# EAGLE schematic schematic (EAGLE 9.7.0)
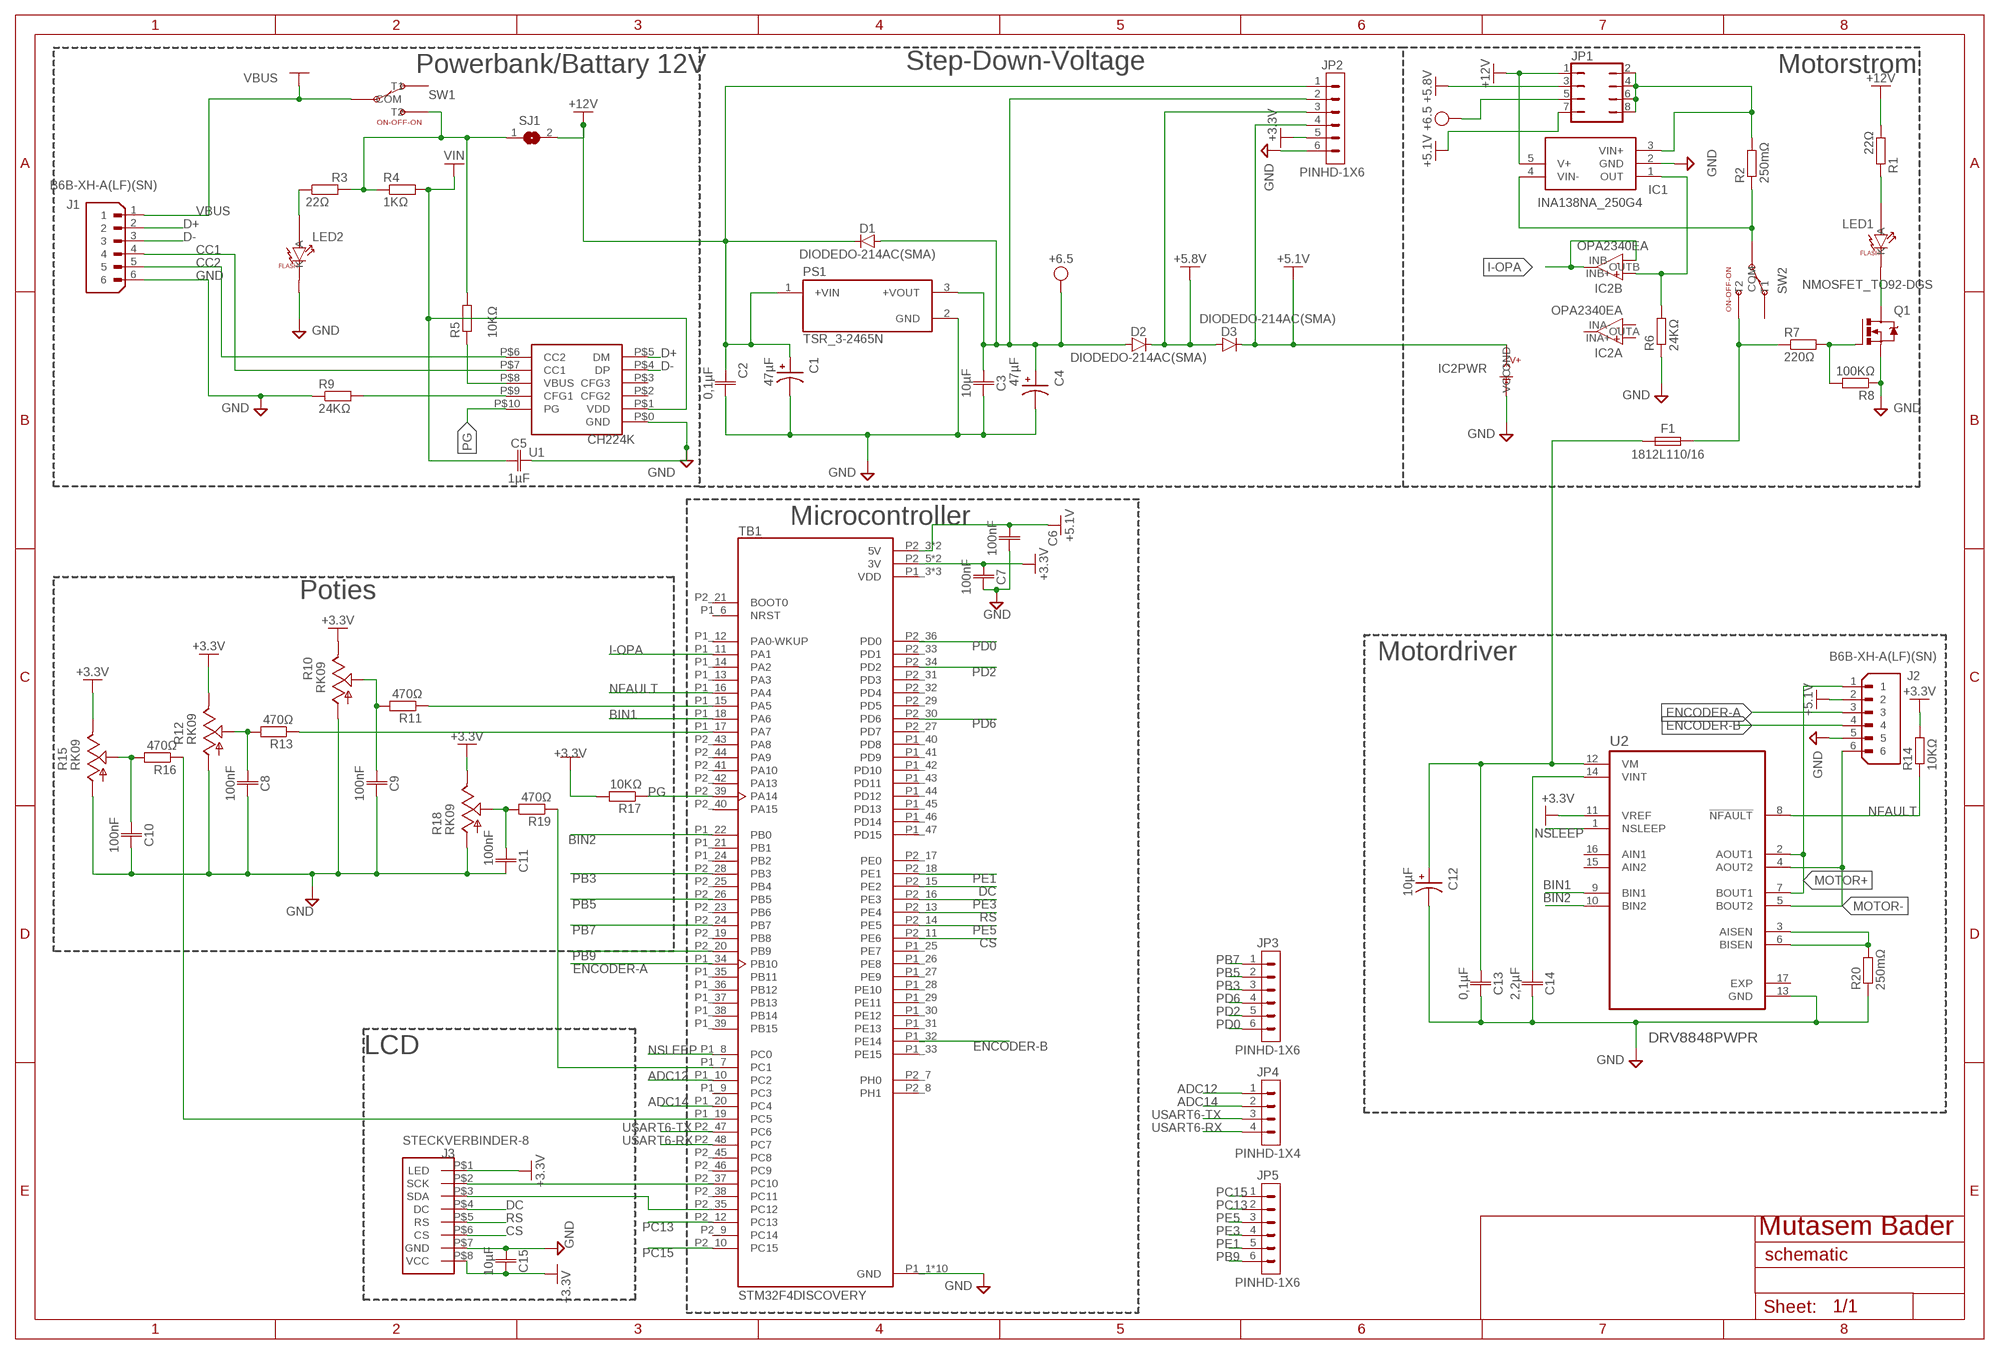
[diagram p0: schematic, sheet 1]

## Parts
C1  47µF  EEUEB1H470SH  [CAPPRD250W50D630H1120]
C2  0,1µF  C_CHIP-1206(3216-METRIC)  [CAPC3216X135]
C3  10µF  C_CHIP-1206(3216-METRIC)  [CAPC3216X135]
C4  47µF  EEUEB1H470SH  [CAPPRD250W50D630H1120]
C5  1µF  C_CHIP-1206(3216-METRIC)  [CAPC3216X135]
C6  100nF  C_CHIP-1206(3216-METRIC)  [CAPC3216X135]
C7  100nF  C_CHIP-1206(3216-METRIC)  [CAPC3216X135]
C8  100nF  C_CHIP-1206(3216-METRIC)  [CAPC3216X135]
C9  100nF  C_CHIP-1206(3216-METRIC)  [CAPC3216X135]
C10  100nF  C_CHIP-1206(3216-METRIC)  [CAPC3216X135]
C11  100nF  C_CHIP-1206(3216-METRIC)  [CAPC3216X135]
C12  10µF  EEUEB1H100S  [CAPPRD200W50D500H1100]
C13  0,1µF  C_CHIP-1206(3216-METRIC)  [CAPC3216X135]
C14  2,2µF  C_CHIP-1206(3216-METRIC)  [CAPC3216X135]
C15  10µF  C_CHIP-1206(3216-METRIC)  [CAPC3216X135]
D1  DIODEDO-214AC(SMA)  [DIOM5226X290N]
D2  DIODEDO-214AC(SMA)  [DIOM5226X290N]
D3  DIODEDO-214AC(SMA)  [DIOM5226X290N]
F1  1812L110/16  [FUSC4532X125]
IC1  INA138NA_250G4  [SOT95P280X145-5N]
IC2  OPA2340EA  [VSSOP-8-DGK]
J1  B6B-XH-A(LF)(SN)  [JST_B6B-XH-A(LF)(SN)]
J2  B6B-XH-A(LF)(SN)  [JST_B6B-XH-A(LF)(SN)]
J3  STECKVERBINDER-8  [STECKEVERINDER-8]
JP1  JP4Q  [JP4Q]
JP2  PINHD-1X6  [1X06]
JP3  PINHD-1X6  [1X06]
JP4  PINHD-1X4  [1X04]
JP5  PINHD-1X6  [1X06]
LED1  19060001-PANEL  [CML-19060001-PANEL-M8]
LED2  19060001-PANEL  [CML-19060001-PANEL-M8]
PS1  TSR_3-2465N  [CONV_TSR_3-2465N]
Q1  NMOSFET_TO92-DGS  [TO92]
R1  22Ω  R_CHIP-1206(3216-METRIC)  [RESC3216X70]
R2  250mΩ  R_CHIP-1206(3216-METRIC)  [RESC3216X70]
R3  22Ω  R_CHIP-1206(3216-METRIC)  [RESC3216X70]
R4  1KΩ  R_CHIP-1206(3216-METRIC)  [RESC3216X70]
R5  10KΩ  R_CHIP-1206(3216-METRIC)  [RESC3216X70]
R6  24KΩ  R_CHIP-1206(3216-METRIC)  [RESC3216X70]
R7  220Ω  R_CHIP-1206(3216-METRIC)  [RESC3216X70]
R8  100KΩ  R_CHIP-1206(3216-METRIC)  [RESC3216X70]
R9  24KΩ  R_CHIP-1206(3216-METRIC)  [RESC3216X70]
R10  RK09  [RK09]
R11  470Ω  R_CHIP-1206(3216-METRIC)  [RESC3216X70]
R12  RK09  [RK09]
R13  470Ω  R_CHIP-1206(3216-METRIC)  [RESC3216X70]
R14  10KΩ  R_CHIP-1206(3216-METRIC)  [RESC3216X70]
R15  RK09  [RK09]
R16  470Ω  R_CHIP-1206(3216-METRIC)  [RESC3216X70]
R17  10KΩ  R_CHIP-1206(3216-METRIC)  [RESC3216X70]
R18  RK09  RK09K1130A6S  [RK09K1130A6S]
R19  470Ω  R_CHIP-1206(3216-METRIC)  [RESC3216X70]
R20  250mΩ  R_CHIP-1206(3216-METRIC)  [RESC3216X70]
SJ1  SJ  [SJ]
SW1  10022-PANEL  [GOOBAY-10022-PANEL]
SW2  10022-PANEL  [GOOBAY-10022-PANEL]
TB1  STM32F4DISCOVERY  [MODULE_STM32F4DISCOVERY]
U1  CH224K  [CH224K]
U2  DRV8848PWPR  [IC_DRV8848PWPR]

## Nets
+3.3V: C7.1 C15.2 J3.P$1(LED) J3.P$8(VCC) JP2.5 R10.A R12.A R14.2 R15.A R17.2 R18.A TB1.P2_5(3V) TB1.P2_6(3V) U2.11(VREF)
+5.1V: C6.1 D3.1(C) IC2.8(PWR:VCC) J2.2 JP1.7 JP2.4 TB1.P2_3(5V) TB1.P2_4(5V)
+5.8V: D2.1(C) D3.2(A) JP1.3 JP2.3
+6.5: C3.1 C4.P D1.2(A) D2.2(A) JP1.5 JP2.2 PS1.3(+VOUT)
+12V: C1.P C2.1 D1.1(C) IC1.5(V+) JP1.1 JP2.1 PS1.1(+VIN) R1.1 SJ1.2
ADC12: JP4.1 TB1.P1_10(PC2)
ADC14: JP4.2 TB1.P1_20(PC4)
BIN1: TB1.P1_18(PA6) U2.9(BIN1)
BIN2: TB1.P1_22(PB0) U2.10(BIN2)
CC1: J1.4 U1.P$7(CC1)
CC2: J1.5 U1.P$6(CC2)
CS: J3.P$6(CS) TB1.P2_11(PE6)
D+: J1.2 U1.P$5(DM)
D-: J1.3 U1.P$4(DP)
DC: J3.P$4(DC) TB1.P2_15(PE2)
ENCODER-A: J2.3 TB1.P1_34(PB10)
ENCODER-B: J2.4 TB1.P1_32(PE14)
GND: C1.N C2.2 C3.2 C4.N C5.2 C6.2 C7.2 C8.2 C9.2 C10.2 C11.2 C12.N C13.2 C14.2 C15.1 IC1.2(GND) IC2.4(PWR:GND) J1.6 J2.5 J3.P$7(GND) JP2.6 LED2.2(K) PS1.2(GND) Q1.3(S) R6.1 R8.1 R9.1 R10.E R12.E R15.E R18.E R20.1 TB1.P1_1(GND) TB1.P1_2(GND) TB1.P1_5(GND) TB1.P1_23(GND) TB1.P1_49(GND) TB1.P1_50(GND) TB1.P2_1(GND) TB1.P2_2(GND) TB1.P2_49(GND) TB1.P2_50(GND) U1.P$0(GND) U2.13(GND)
I-OPA: IC2.6(B:INB-) IC2.7(B:OUTB) TB1.P1_11(PA1)
MOTOR+: J2.1 U2.2(AOUT1) U2.7(BOUT1)
MOTOR-: J2.6 U2.4(AOUT2) U2.5(BOUT2)
N$1: R5.1 U1.P$8(VBUS)
N$2: R9.2 U1.P$9(CFG1)
N$5: C14.1 U2.14(VINT)
N$8: C9.1 R10.S R11.2
N$10: Q1.2(G) R7.2 R8.2
N$11: IC1.4(VIN-) R2.1 SW2.2(COM)
N$13: LED1.1(A) R1.2
N$14: F1.2 R7.1 SW2.3(T2)
N$15: R20.2 U2.3(AISEN) U2.6(BISEN)
N$17: IC1.1(OUT) IC2.5(B:INB+) R6.2
N$18: IC1.3(VIN+) JP1.2 JP1.4 JP1.6 JP1.8 R2.2
N$19: C8.1 R12.S R13.2
N$20: C10.1 R15.S R16.2
N$21: R19.1 TB1.P1_7(PC1)
N$22: C11.1 R18.S R19.2
N$23: R16.1 TB1.P1_19(PC5)
N$31: R11.1 TB1.P1_15(PA5)
N$32: LED2.1(A) R3.1
N$33: R3.2 R4.1 R5.2 SJ1.1 SW1.3(T2)
N$34: C12.P C13.1 F1.1 U2.12(VM)
N$36: R13.1 TB1.P1_17(PA7)
N$37: LED1.2(K) Q1.1(D)
NFAULT: R14.1 TB1.P1_16(PA4) U2.8(!NFAULT)
NSLEEP: TB1.P1_8(PC0) U2.1(NSLEEP)
PB3: JP3.3 TB1.P2_28(PB3)
PB5: JP3.2 TB1.P2_26(PB5)
PB7: JP3.1 TB1.P2_24(PB7)
PB9: JP5.6 TB1.P2_20(PB9)
PC13: JP5.2 TB1.P2_12(PC13)
PC15: JP5.1 TB1.P2_10(PC15)
PD0: JP3.6 TB1.P2_36(PD0)
PD2: JP3.5 TB1.P2_34(PD2)
PD6: JP3.4 TB1.P2_30(PD6)
PE1: JP5.5 TB1.P2_18(PE1)
PE3: JP5.4 TB1.P2_16(PE3)
PE5: JP5.3 TB1.P2_14(PE5)
PG: R17.1 TB1.P2_39(PA14) U1.P$10(PG)
RS: J3.P$5(RS) TB1.P2_13(PE4)
SCK: J3.P$2(SCK) TB1.P2_37(PC10)
SDA: J3.P$3(SDA) TB1.P2_35(PC12)
USART6-RX: JP4.4 TB1.P2_48(PC7)
USART6-TX: JP4.3 TB1.P2_47(PC6)
VBUS: J1.1 SW1.2(COM)
VIN: C5.1 R4.2 U1.P$1(VDD)
Unconnected: IC2.1(A:OUTA) IC2.2(A:INA-) IC2.3(A:INA+) SW1.1(T1) SW2.1(T1) TB1.P1_6(NRST) TB1.P1_9(PC3) TB1.P1_12(PA0-WKUP) TB1.P1_13(PA3) TB1.P1_14(PA2) TB1.P1_21(PB1) TB1.P1_24(PB2) TB1.P1_25(PE7) TB1.P1_26(PE8) TB1.P1_27(PE9) TB1.P1_28(PE10) TB1.P1_29(PE11) TB1.P1_30(PE12) TB1.P1_31(PE13) TB1.P1_33(PE15) TB1.P1_35(PB11) TB1.P1_36(PB12) TB1.P1_37(PB13) TB1.P1_38(PB14) TB1.P1_39(PB15) TB1.P1_40(PD8) TB1.P1_41(PD9) TB1.P1_42(PD10) TB1.P1_43(PD11) TB1.P1_44(PD12) TB1.P1_45(PD13) TB1.P1_46(PD14) TB1.P1_47(PD15) TB1.P2_7(PH0) TB1.P2_8(PH1) TB1.P2_9(PC14) TB1.P2_17(PE0) TB1.P2_19(PB8) TB1.P2_21(BOOT0) TB1.P2_23(PB6) TB1.P2_25(PB4) TB1.P2_27(PD7) TB1.P2_29(PD5) TB1.P2_31(PD3) TB1.P2_32(PD4) TB1.P2_33(PD1) TB1.P2_38(PC11) TB1.P2_40(PA15) TB1.P2_41(PA10) TB1.P2_42(PA13) TB1.P2_43(PA8) TB1.P2_44(PA9) TB1.P2_45(PC8) TB1.P2_46(PC9) U1.P$2(CFG2) U1.P$3(CFG3) U2.15(AIN2) U2.16(AIN1) U2.17(EXP)

## Notes on the sheet
- Powerbank/Battary 12V | Motorstrom
- Step-Down-Voltage
- Microcontroller
- Poties
- Motordriver
- LCD
- Mutasem Bader

## Power pins joined to a net without a drawn wire
VDD: TB1.P1_3(VDD) TB1.P1_4(VDD) TB1.P2_22(VDD)

## Library data of the parts
C1 C4 = EEUEB1H470SH:EEUEB1H470SH: Check availability <https://pricing.snapeda.com/parts/EEUEB1H470SH/Panasonic/view-part?ref=eda>
C2 C3 C5-C11 C13-C15 = Capacitor:C: Capacitor - Generic
C12 = EEUEB1H100S:EEUEB1H100S: Check availability <https://pricing.snapeda.com/parts/EEUEB1H100S/Panasonic/view-part?ref=eda>
D1-D3 = Diode:DIODE: Diode Rectifier - Generic
F1 = Fuse:1812L: 1812L Series PTC provides surface mount overcurrent protection for applications where resettable protection is desired. Datasheet <https://www.littelfuse.com/assetdocs/resettable-ptcs-1812l-datasheet?assetguid=ca5c80cb-504e-4a8a-8e74-0107520a1717>
IC1 = INA138NA_250G4:INA138NA_250G4: High-Side Measurement CURRENT SHUNT MONITOR Source: Datasheet <http://www.ti.com/lit/ds/symlink/ina138.pdf>
IC2 = TI_OPA2340EA:OPA2340EA: Texas Instruments OPA2340EA — Dual Rail-to-Rail Op-Amp, VSSOP-8 Single-supply, rail-to-rail CMOS, 2,5–5,5 V, GBW 5,5 MHz, SR 6 V/µs, IQ 750 µA/Kanal. Temperaturbereich: −40°C bis +85°C (spezifiziert), −55°C bis +125°C (Betrieb). Gehäuse: VSSOP-8 (DGK), 3,0 × 3,0 mm, JEDEC MO-187, MSL Level-2-260°C-1 Year. Datenblatt: SBOS073C | Reichelt: 188939 | TI MPN: OPA2340EA/250 Pin-Belegung (Package DGK0008A): 1=OUT_A 2=IN-_A 3=IN+_A 4=V- 5=IN+_B 6=IN-_B 7=OUT_B 8=V+ Alle Package-Maße direkt aus TI-Datenblatt SBOS073C, 4214862/A 04/2023 (keine Schätzungen).
J1 J2 = B6B-XH-A_LF__SN_:B6B-XH-A(LF)(SN): Check availability <https://pricing.snapeda.com/parts/B6B-XH-A%28LF%29%28SN%29/JST%20Sales%20America%20Inc./view-part?ref=eda>
J3 = Steckverbinder-8:STECKVERBINDER-8
JP1 = jumper_JP4Q:JP4Q: JUMPER
JP2 JP3 JP5 = Connector:PINHD-1X6: Pin Header
JP4 = Connector:PINHD-1X4: Pin Header
LED1 LED2 = CML_19060001:19060001: CML Innovative Technologies 19060001 LED-Signalleuchte, Grün blinkend, 3,5–13 V DC, eingebauter Blinkoszillator. Gewinde: M8 x 0,75 | Hex: SW10 | Körper: 11,5 mm | Blende: ø9,5 mm Anschlüsse: 2 Drahtleitungen (Anode 12 mm, Kathode 14 mm) Pitch: 2,54 mm GESCHÄTZT — vor Serienfertigung bei CML bestätigen IP40 | RoHS | Reichelt-Art.-Nr. 271929
PS1 = TSR-3N:TSR_3-2465N: Check availability <https://pricing.snapeda.com/parts/TSR%203-2465N/Traco%20Power/view-part?ref=eda>
Q1 = Transistor:NMOSFET: N-Channel MOSFET - Generic
R1-R9 R11 R13 R14 R16 R17 R19 R20 = Resistor:R: Resistor Fixed - Generic
R10 R12 R15 = RK09:RK09: Check availability <https://pricing.snapeda.com/parts/RK09K1130A6S/ALPS/view-part?ref=eda>
R18 = RK09:RK09K1130A6S: Check availability <https://pricing.snapeda.com/parts/RK09K1130A6S/ALPS/view-part?ref=eda>
SJ1 = jumper:SJ: SMD solder JUMPER
SW1 SW2 = GOOBAY_10022:10022: Goobay / Wentronic 10022 Miniatur-Kippschalter EIN-AUS-EIN (SPDT ON-OFF-ON), 3 A / 250 V AC. Anschluss: 3 Lötösen | Farbe: Blau/Silber | RoHS Gehäuse: 8 x 12,9 x 33 mm | Montage: Panelbohrung 6,5 mm Pin-Pitch: 4,70 mm (GESCHÄTZT aus M1QE-Referenz — bei Wentronic bestätigen) Reichelt-Art.-Nr.: 285989 | EAN: 4040849100222
TB1 = STM32F4DISCOVERY:STM32F4DISCOVERY: Check availability <https://pricing.snapeda.com/parts/STM32F4DISCOVERY/STMicroelectronics/view-part?ref=eda>
U1 = CH224K:CH224K
U2 = DRV8848PWPR:DRV8848PWPR: Check availability <https://pricing.snapeda.com/parts/DRV8848PWPR/Texas%20Instruments/view-part?ref=eda>